# Altium project Membrane_Board.PrjPcb (part 2 of 2)

## Sheet Header_Sheet_4.SchDoc
size A4; SheetNumber: 10; SheetTotal: 12
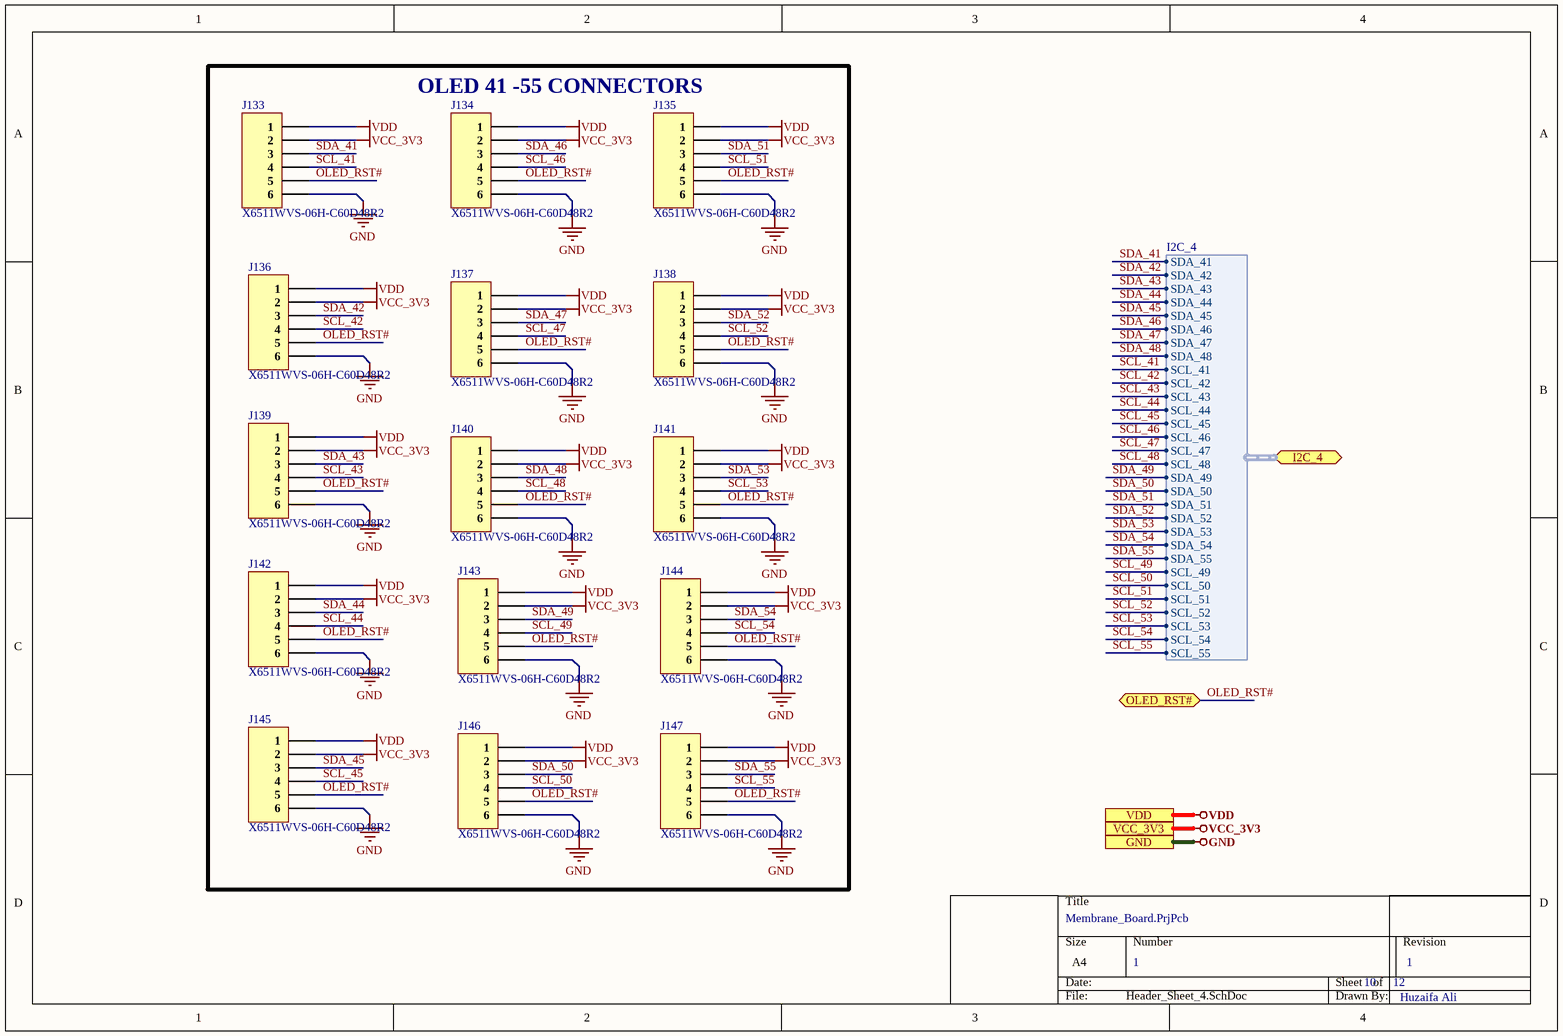
[diagram p9: Header_Sheet_4.SchDoc]

### Parts
J133  X6511WVS-06H-C60D48R2  [X6511WVS-06H-C60D48R2]
J134  X6511WVS-06H-C60D48R2  [X6511WVS-06H-C60D48R2]
J135  X6511WVS-06H-C60D48R2  [X6511WVS-06H-C60D48R2]
J136  X6511WVS-06H-C60D48R2  [X6511WVS-06H-C60D48R2]
J137  X6511WVS-06H-C60D48R2  [X6511WVS-06H-C60D48R2]
J138  X6511WVS-06H-C60D48R2  [X6511WVS-06H-C60D48R2]
J139  X6511WVS-06H-C60D48R2  [X6511WVS-06H-C60D48R2]
J140  X6511WVS-06H-C60D48R2  [X6511WVS-06H-C60D48R2]
J141  X6511WVS-06H-C60D48R2  [X6511WVS-06H-C60D48R2]
J142  X6511WVS-06H-C60D48R2  [X6511WVS-06H-C60D48R2]
J143  X6511WVS-06H-C60D48R2  [X6511WVS-06H-C60D48R2]
J144  X6511WVS-06H-C60D48R2  [X6511WVS-06H-C60D48R2]
J145  X6511WVS-06H-C60D48R2  [X6511WVS-06H-C60D48R2]
J146  X6511WVS-06H-C60D48R2  [X6511WVS-06H-C60D48R2]
J147  X6511WVS-06H-C60D48R2  [X6511WVS-06H-C60D48R2]

### Blocks framed on the sheet
OLED 41 -55 CONNECTORS: J133-J147

### Ports
GND, I2C_4 (bidir, harness I2C_4), OLED_RST# (bidir), VCC_3V3, VDD

### Harnesses
I2C_4: SDA_41, SDA_42, SDA_43, SDA_44, SDA_45, SDA_46, SDA_47, SDA_48, SCL_41, SCL_42, SCL_43, SCL_44, SCL_45, SCL_46, SCL_47, SCL_48, SDA_49, SDA_50, SDA_51, SDA_52, SDA_53, SDA_54, SDA_55, SCL_49, SCL_50, SCL_51, SCL_52, SCL_53, SCL_54, SCL_55

### Nets
GND: J133.6 J134.6 J135.6 J136.6 J137.6 J138.6 J139.6 J140.6 J141.6 J142.6 J143.6 J144.6 J145.6 J146.6 J147.6 ; port GND
VCC_3V3: J133.2 J134.2 J135.2 J136.2 J137.2 J138.2 J139.2 J140.2 J141.2 J142.2 J143.2 J144.2 J145.2 J146.2 J147.2 ; port VCC_3V3
VDD: J133.1 J134.1 J135.1 J136.1 J137.1 J138.1 J139.1 J140.1 J141.1 J142.1 J143.1 J144.1 J145.1 J146.1 J147.1 ; port VDD
OLED_RST#: J133.5 J134.5 J135.5 J136.5 J137.5 J138.5 J139.5 J140.5 J141.5 J142.5 J143.5 J144.5 J145.5 J146.5 J147.5 ; port OLED_RST#
SCL_41: J133.4 ; port I2C_4.SCL_41  [project net I2C_4.SCL_41]
SCL_42: J136.4 ; port I2C_4.SCL_42  [project net I2C_4.SCL_42]
SCL_43: J139.4 ; port I2C_4.SCL_43  [project net I2C_4.SCL_43]
SCL_44: J142.4 ; port I2C_4.SCL_44  [project net I2C_4.SCL_44]
SCL_45: J145.4 ; port I2C_4.SCL_45  [project net I2C_4.SCL_45]
SCL_46: J134.4 ; port I2C_4.SCL_46  [project net I2C_4.SCL_46]
SCL_47: J137.4 ; port I2C_4.SCL_47  [project net I2C_4.SCL_47]
SCL_48: J140.4 ; port I2C_4.SCL_48  [project net I2C_4.SCL_48]
SCL_49: J143.4 ; port I2C_4.SCL_49  [project net I2C_4.SCL_49]
SCL_50: J146.4 ; port I2C_4.SCL_50  [project net I2C_4.SCL_50]
SCL_51: J135.4 ; port I2C_4.SCL_51  [project net I2C_4.SCL_51]
SCL_52: J138.4 ; port I2C_4.SCL_52  [project net I2C_4.SCL_52]
SCL_53: J141.4 ; port I2C_4.SCL_53  [project net I2C_4.SCL_53]
SCL_54: J144.4 ; port I2C_4.SCL_54  [project net I2C_4.SCL_54]
SCL_55: J147.4 ; port I2C_4.SCL_55  [project net I2C_4.SCL_55]
SDA_41: J133.3 ; port I2C_4.SDA_41  [project net I2C_4.SDA_41]
SDA_42: J136.3 ; port I2C_4.SDA_42  [project net I2C_4.SDA_42]
SDA_43: J139.3 ; port I2C_4.SDA_43  [project net I2C_4.SDA_43]
SDA_44: J142.3 ; port I2C_4.SDA_44  [project net I2C_4.SDA_44]
SDA_45: J145.3 ; port I2C_4.SDA_45  [project net I2C_4.SDA_45]
SDA_46: J134.3 ; port I2C_4.SDA_46  [project net I2C_4.SDA_46]
SDA_47: J137.3 ; port I2C_4.SDA_47  [project net I2C_4.SDA_47]
SDA_48: J140.3 ; port I2C_4.SDA_48  [project net I2C_4.SDA_48]
SDA_49: J143.3 ; port I2C_4.SDA_49  [project net I2C_4.SDA_49]
SDA_50: J146.3 ; port I2C_4.SDA_50  [project net I2C_4.SDA_50]
SDA_51: J135.3 ; port I2C_4.SDA_51  [project net I2C_4.SDA_51]
SDA_52: J138.3 ; port I2C_4.SDA_52  [project net I2C_4.SDA_52]
SDA_53: J141.3 ; port I2C_4.SDA_53  [project net I2C_4.SDA_53]
SDA_54: J144.3 ; port I2C_4.SDA_54  [project net I2C_4.SDA_54]
SDA_55: J147.3 ; port I2C_4.SDA_55  [project net I2C_4.SDA_55]

### Notes on the sheet
- 1
- Huzaifa Ali

### Library data of the parts
J133-J147 = X6511WVS-06H-C60D48R2: 6 POS 2.54mm SMD Header; Manufacturer: XKB Connectivity; Voltage Rating (Max): 250V; Current Rating (Max): 3A; Circluar Pins/Square Pins: Square Pins; ComponentLink1Description: LCSC; ComponentLink1URL: https://lcsc.com/product-detail/span-style-background-color-ff0-Pin-span-Headers_XKB-Connectivity-X6511WVS-06H-C60D48R2_C2883763.html; Insulation Height: 2.5mm; Length of Mating Pin: 6mm

## Sheet Button_Sheet_1.SchDoc
size A; SheetNumber: 11; SheetTotal: 12
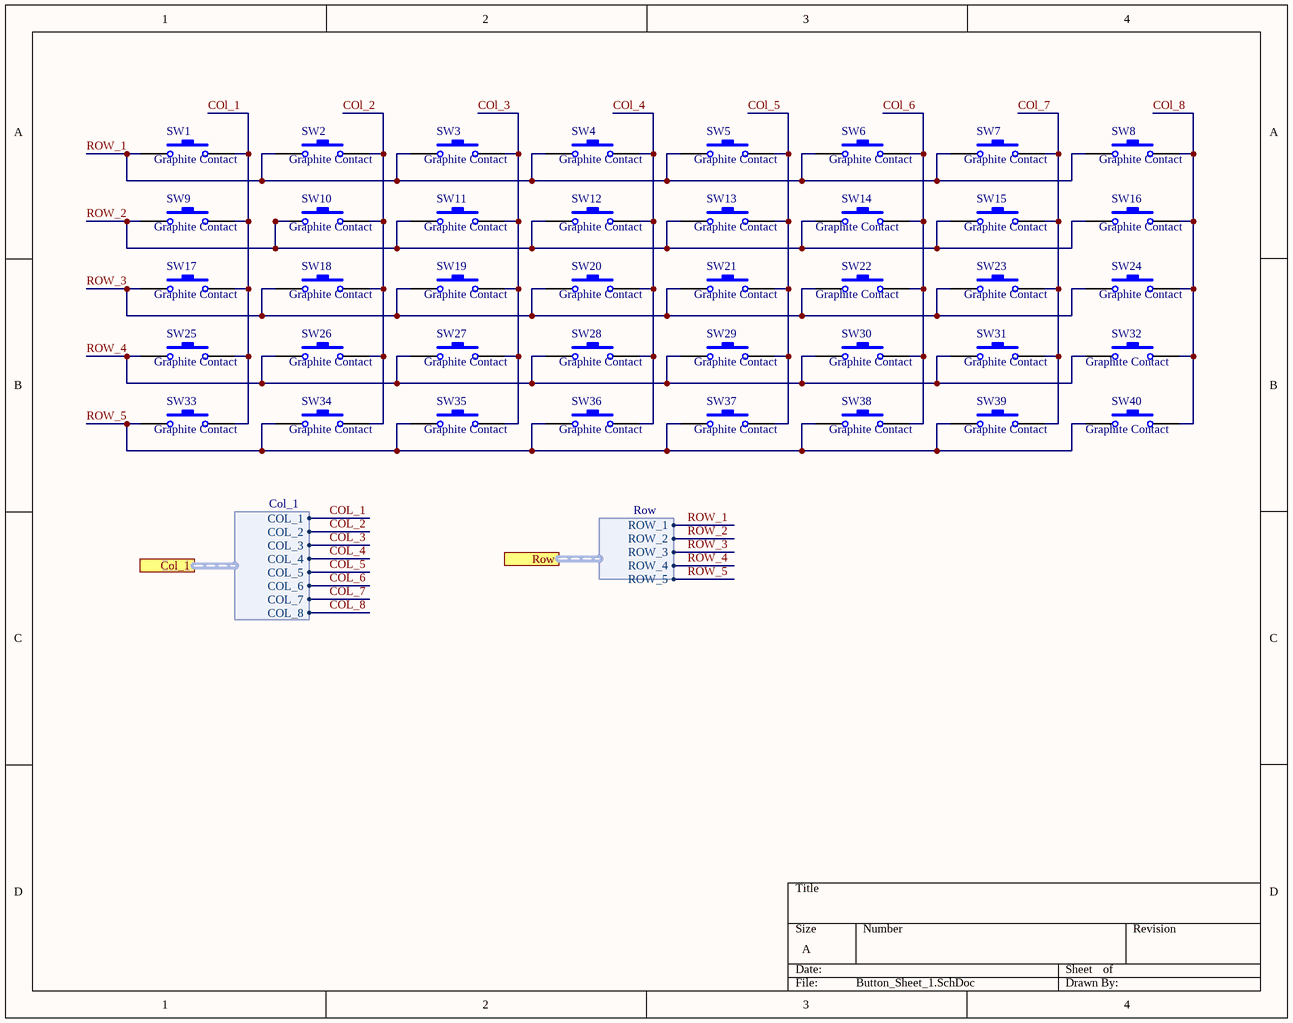
[diagram p10: Button_Sheet_1.SchDoc]

### Parts
SW1  Graphite Contact  [Graphite Contact]
SW2  Graphite Contact  [Graphite Contact]
SW3  Graphite Contact  [Graphite Contact]
SW4  Graphite Contact  [Graphite Contact]
SW5  Graphite Contact  [Graphite Contact]
SW6  Graphite Contact  [Graphite Contact]
SW7  Graphite Contact  [Graphite Contact]
SW8  Graphite Contact  [Graphite Contact]
SW9  Graphite Contact  [Graphite Contact]
SW10  Graphite Contact  [Graphite Contact]
SW11  Graphite Contact  [Graphite Contact]
SW12  Graphite Contact  [Graphite Contact]
SW13  Graphite Contact  [Graphite Contact]
SW14  Graphite Contact  [Graphite Contact]
SW15  Graphite Contact  [Graphite Contact]
SW16  Graphite Contact  [Graphite Contact]
SW17  Graphite Contact  [Graphite Contact]
SW18  Graphite Contact  [Graphite Contact]
SW19  Graphite Contact  [Graphite Contact]
SW20  Graphite Contact  [Graphite Contact]
SW21  Graphite Contact  [Graphite Contact]
SW22  Graphite Contact  [Graphite Contact]
SW23  Graphite Contact  [Graphite Contact]
SW24  Graphite Contact  [Graphite Contact]
SW25  Graphite Contact  [Graphite Contact]
SW26  Graphite Contact  [Graphite Contact]
SW27  Graphite Contact  [Graphite Contact]
SW28  Graphite Contact  [Graphite Contact]
SW29  Graphite Contact  [Graphite Contact]
SW30  Graphite Contact  [Graphite Contact]
SW31  Graphite Contact  [Graphite Contact]
SW32  Graphite Contact  [Graphite Contact]
SW33  Graphite Contact  [Graphite Contact]
SW34  Graphite Contact  [Graphite Contact]
SW35  Graphite Contact  [Graphite Contact]
SW36  Graphite Contact  [Graphite Contact]
SW37  Graphite Contact  [Graphite Contact]
SW38  Graphite Contact  [Graphite Contact]
SW39  Graphite Contact  [Graphite Contact]
SW40  Graphite Contact  [Graphite Contact]

### Ports
Col_1 (harness Col_1), Row (harness Row)

### Harnesses
Col_1: COL_8, COL_7, COL_6, COL_5, COL_4, COL_3, COL_2, COL_1
Row: ROW_5, ROW_4, ROW_3, ROW_2, ROW_1

### Nets
COL_1: SW1.2 SW9.2 SW17.2 SW25.2 SW33.2 ; port Col_1.COL_1
COl_2: SW2.2 SW10.2 SW18.2 SW26.2 SW34.2 ; port Col_1.COL_2  [project net Col_1.COL_2]
COl_3: SW3.2 SW11.2 SW19.2 SW27.2 SW35.2 ; port Col_1.COL_3  [project net Col_1.COL_3]
COl_4: SW4.2 SW12.2 SW20.2 SW28.2 SW36.2 ; port Col_1.COL_4  [project net Col_1.COL_4]
COl_5: SW5.2 SW13.2 SW21.2 SW29.2 SW37.2 ; port Col_1.COL_5  [project net Col_1.COL_5]
COl_6: SW6.2 SW14.2 SW22.2 SW30.2 SW38.2 ; port Col_1.COL_6  [project net Col_1.COL_6]
COl_7: SW7.2 SW15.2 SW23.2 SW31.2 SW39.2 ; port Col_1.COL_7  [project net Col_1.COL_7]
COl_8: SW8.2 SW16.2 SW24.2 SW32.2 SW40.2 ; port Col_1.COL_8  [project net Col_1.COL_8]
ROW_1: SW1.1 SW2.1 SW3.1 SW4.1 SW5.1 SW6.1 SW7.1 SW8.1 ; port Row.ROW_1  [project net Row.ROW_1]
ROW_2: SW9.1 SW10.1 SW11.1 SW12.1 SW13.1 SW14.1 SW15.1 SW16.1 ; port Row.ROW_2  [project net Row.ROW_2]
ROW_3: SW17.1 SW18.1 SW19.1 SW20.1 SW21.1 SW22.1 SW23.1 SW24.1 ; port Row.ROW_3  [project net Row.ROW_3]
ROW_4: SW25.1 SW26.1 SW27.1 SW28.1 SW29.1 SW30.1 SW31.1 SW32.1 ; port Row.ROW_4  [project net Row.ROW_4]
ROW_5: SW33.1 SW34.1 SW35.1 SW36.1 SW37.1 SW38.1 SW39.1 SW40.1 ; port Row.ROW_5  [project net Row.ROW_5]

### Library data of the parts
SW1-SW40 = Graphite Contact: Push Button for Graphite Contact

## Sheet Button_Sheet_2.SchDoc
size A; SheetNumber: 12; SheetTotal: 12
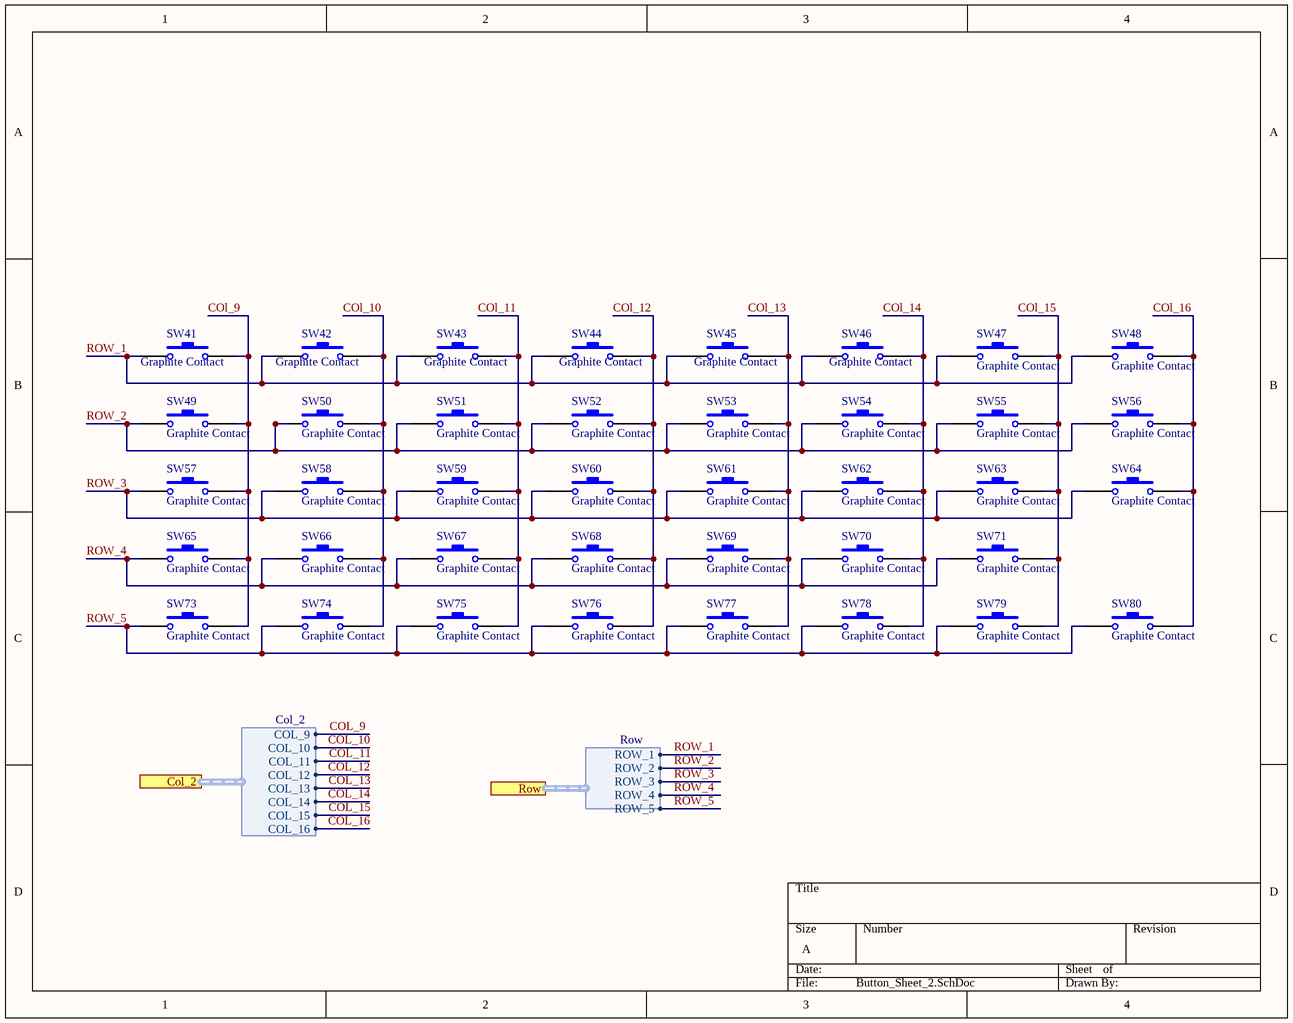
[diagram p11: Button_Sheet_2.SchDoc]

### Parts
SW41  Graphite Contact  [Graphite Contact]
SW42  Graphite Contact  [Graphite Contact]
SW43  Graphite Contact  [Graphite Contact]
SW44  Graphite Contact  [Graphite Contact]
SW45  Graphite Contact  [Graphite Contact]
SW46  Graphite Contact  [Graphite Contact]
SW47  Graphite Contact  [Graphite Contact]
SW48  Graphite Contact  [Graphite Contact]
SW49  Graphite Contact  [Graphite Contact]
SW50  Graphite Contact  [Graphite Contact]
SW51  Graphite Contact  [Graphite Contact]
SW52  Graphite Contact  [Graphite Contact]
SW53  Graphite Contact  [Graphite Contact]
SW54  Graphite Contact  [Graphite Contact]
SW55  Graphite Contact  [Graphite Contact]
SW56  Graphite Contact  [Graphite Contact]
SW57  Graphite Contact  [Graphite Contact]
SW58  Graphite Contact  [Graphite Contact]
SW59  Graphite Contact  [Graphite Contact]
SW60  Graphite Contact  [Graphite Contact]
SW61  Graphite Contact  [Graphite Contact]
SW62  Graphite Contact  [Graphite Contact]
SW63  Graphite Contact  [Graphite Contact]
SW64  Graphite Contact  [Graphite Contact]
SW65  Graphite Contact  [Graphite Contact]
SW66  Graphite Contact  [Graphite Contact]
SW67  Graphite Contact  [Graphite Contact]
SW68  Graphite Contact  [Graphite Contact]
SW69  Graphite Contact  [Graphite Contact]
SW70  Graphite Contact  [Graphite Contact]
SW71  Graphite Contact  [Graphite Contact]
SW73  Graphite Contact  [Graphite Contact]
SW74  Graphite Contact  [Graphite Contact]
SW75  Graphite Contact  [Graphite Contact]
SW76  Graphite Contact  [Graphite Contact]
SW77  Graphite Contact  [Graphite Contact]
SW78  Graphite Contact  [Graphite Contact]
SW79  Graphite Contact  [Graphite Contact]
SW80  Graphite Contact  [Graphite Contact]

### Ports
Col_2 (harness Col_2), Row (harness Row)

### Harnesses
Col_2: COL_16, COL_15, COL_14, COL_13, COL_12, COL_11, COL_10, COL_9
Row: ROW_5, ROW_4, ROW_3, ROW_2, ROW_1

### Nets
COl_9: SW41.2 SW49.2 SW57.2 SW65.2 SW73.2 ; port Col_2.COL_9  [project net Col_2.COL_9]
COL_10: SW42.2 SW50.2 SW58.2 SW66.2 SW74.2 ; port Col_2.COL_10
COL_11: SW43.2 SW51.2 SW59.2 SW67.2 SW75.2 ; port Col_2.COL_11
COL_12: SW44.2 SW52.2 SW60.2 SW68.2 SW76.2 ; port Col_2.COL_12
COL_13: SW45.2 SW53.2 SW61.2 SW69.2 SW77.2 ; port Col_2.COL_13
COL_14: SW46.2 SW54.2 SW62.2 SW70.2 SW78.2 ; port Col_2.COL_14
COL_15: SW47.2 SW55.2 SW63.2 SW71.2 SW79.2 ; port Col_2.COL_15
COL_16: SW48.2 SW56.2 SW64.2 SW80.2 ; port Col_2.COL_16
ROW_1: SW41.1 SW42.1 SW43.1 SW44.1 SW45.1 SW46.1 SW47.1 SW48.1 ; port Row.ROW_1  [project net Row.ROW_1]
ROW_2: SW49.1 SW50.1 SW51.1 SW52.1 SW53.1 SW54.1 SW55.1 SW56.1 ; port Row.ROW_2  [project net Row.ROW_2]
ROW_3: SW57.1 SW58.1 SW59.1 SW60.1 SW61.1 SW62.1 SW63.1 SW64.1 ; port Row.ROW_3  [project net Row.ROW_3]
ROW_4: SW65.1 SW66.1 SW67.1 SW68.1 SW69.1 SW70.1 SW71.1 ; port Row.ROW_4  [project net Row.ROW_4]
ROW_5: SW73.1 SW74.1 SW75.1 SW76.1 SW77.1 SW78.1 SW79.1 SW80.1 ; port Row.ROW_5  [project net Row.ROW_5]

### Library data of the parts
SW41-SW71 SW73-SW80 = Graphite Contact: Push Button for Graphite Contact

## Nets that join several sheets
GND: Connector_Sheet_1 (17 pins), Connector_Sheet_2 (25 pins), Connector_Sheet_3 (17 pins), Connector_Sheet_4 (7 pins), Controller_Sheet_5 (J75.26 J75.MP1 J75.MP2), Header_Sheet_1 (25 pins), Header_Sheet_2 (22 pins), Header_Sheet_3 (20 pins), Header_Sheet_4 (15 pins)
VCC_3V3: Connector_Sheet_1 (15 pins), Connector_Sheet_2 (25 pins), Connector_Sheet_3 (15 pins), Connector_Sheet_4 (7 pins), Controller_Sheet_5 (J75.25), Header_Sheet_1 (25 pins), Header_Sheet_2 (22 pins), Header_Sheet_3 (20 pins), Header_Sheet_4 (15 pins)
VDD: Connector_Sheet_1 (15 pins), Connector_Sheet_2 (25 pins), Connector_Sheet_3 (15 pins), Connector_Sheet_4 (7 pins), Controller_Sheet_5 (J75.24), Header_Sheet_1 (25 pins), Header_Sheet_2 (22 pins), Header_Sheet_3 (20 pins), Header_Sheet_4 (15 pins)
COL_1: Controller_Sheet_5 (J75.1 P1.1), Button_Sheet_1 (5 pins)
Col_1.COL_2: Controller_Sheet_5 (J75.2 P2.1), Button_Sheet_1 (5 pins)
Col_1.COL_3: Controller_Sheet_5 (J75.3 P3.1), Button_Sheet_1 (5 pins)
Col_1.COL_4: Controller_Sheet_5 (J75.4 P4.1), Button_Sheet_1 (5 pins)
Col_1.COL_5: Controller_Sheet_5 (J75.5 P5.1), Button_Sheet_1 (5 pins)
Col_1.COL_6: Controller_Sheet_5 (J75.6 P6.1), Button_Sheet_1 (5 pins)
Col_1.COL_7: Controller_Sheet_5 (J75.7 P7.1), Button_Sheet_1 (5 pins)
Col_1.COL_8: Controller_Sheet_5 (J75.8 P8.1), Button_Sheet_1 (5 pins)
Col_2.COL_9: Controller_Sheet_5 (J75.9 P9.1), Button_Sheet_2 (5 pins)
COL_10: Controller_Sheet_5 (J75.10 P10.1), Button_Sheet_2 (5 pins)
COL_11: Controller_Sheet_5 (J75.11 P11.1), Button_Sheet_2 (5 pins)
COL_12: Controller_Sheet_5 (J75.12 P12.1), Button_Sheet_2 (5 pins)
COL_13: Controller_Sheet_5 (J75.13 P13.1), Button_Sheet_2 (5 pins)
COL_14: Controller_Sheet_5 (J75.14 P14.1), Button_Sheet_2 (5 pins)
COL_15: Controller_Sheet_5 (J75.15 P15.1), Button_Sheet_2 (5 pins)
COL_16: Controller_Sheet_5 (J75.16 P16.1), Button_Sheet_2 (SW48.2 SW56.2 SW64.2 SW80.2)
I2C1.SCL_1: Connector_Sheet_1 (J4.9), Connector_Sheet_2 (J17.4), Header_Sheet_1 (J45.4)
I2C1.SCL_2: Connector_Sheet_1 (J4.10), Connector_Sheet_2 (J22.4), Header_Sheet_1 (J57.4)
I2C1.SCL_3: Connector_Sheet_1 (J4.11), Connector_Sheet_2 (J27.4), Header_Sheet_1 (J76.4)
I2C1.SCL_4: Connector_Sheet_1 (J4.12), Connector_Sheet_2 (J32.4), Header_Sheet_1 (J81.4)
I2C1.SCL_5: Connector_Sheet_1 (J4.13), Connector_Sheet_2 (J37.4), Header_Sheet_1 (J86.4)
I2C1.SCL_6: Connector_Sheet_1 (J4.14), Connector_Sheet_2 (J18.4), Header_Sheet_1 (J46.4)
I2C1.SCL_7: Connector_Sheet_1 (J4.15), Connector_Sheet_2 (J23.4), Header_Sheet_1 (J61.4)
I2C1.SCL_8: Connector_Sheet_1 (J4.16), Connector_Sheet_2 (J28.4), Header_Sheet_1 (J77.4)
I2C1.SCL_9: Connector_Sheet_1 (J4.25), Connector_Sheet_2 (J33.4), Header_Sheet_1 (J82.4)
I2C1.SCL_10: Connector_Sheet_1 (J4.26), Connector_Sheet_2 (J38.4), Header_Sheet_1 (J87.4)
I2C1.SCL_11: Connector_Sheet_1 (J4.27), Connector_Sheet_2 (J19.4), Header_Sheet_1 (J51.4)
I2C1.SCL_12: Connector_Sheet_1 (J4.28), Connector_Sheet_2 (J24.4), Header_Sheet_1 (J62.4)
I2C1.SCL_13: Connector_Sheet_1 (J4.29), Connector_Sheet_2 (J29.4), Header_Sheet_1 (J78.4)
I2C1.SCL_14: Connector_Sheet_1 (J4.30), Connector_Sheet_2 (J34.4), Header_Sheet_1 (J83.4)
I2C1.SCL_15: Connector_Sheet_1 (J4.31), Connector_Sheet_2 (J39.4), Header_Sheet_1 (J88.4)
I2C1.SCL_16: Connector_Sheet_1 (J4.32), Connector_Sheet_2 (J20.4), Header_Sheet_1 (J52.4)
I2C1.SCL_17: Connector_Sheet_1 (J4.41), Connector_Sheet_2 (J25.4), Header_Sheet_1 (J66.4)
I2C1.SCL_18: Connector_Sheet_1 (J4.42), Connector_Sheet_2 (J30.4), Header_Sheet_1 (J79.4)
I2C1.SCL_19: Connector_Sheet_1 (J4.43), Connector_Sheet_2 (J35.4), Header_Sheet_1 (J84.4)
I2C1.SCL_20: Connector_Sheet_1 (J4.44), Connector_Sheet_2 (J40.4), Header_Sheet_1 (J89.4)
I2C1.SCL_21: Connector_Sheet_1 (J4.45), Connector_Sheet_2 (J21.4), Header_Sheet_1 (J56.4)
I2C1.SCL_22: Connector_Sheet_1 (J4.46), Connector_Sheet_2 (J26.4), Header_Sheet_1 (J67.4)
I2C1.SCL_23: Connector_Sheet_1 (J4.47), Connector_Sheet_2 (J31.4), Header_Sheet_1 (J80.4)
I2C1.SCL_24: Connector_Sheet_1 (J4.48), Connector_Sheet_2 (J36.4), Header_Sheet_1 (J85.4)
I2C1.SCL_25: Connector_Sheet_1 (J4.57), Connector_Sheet_2 (J41.4), Header_Sheet_1 (J90.4)
I2C1.SDA_1: Connector_Sheet_1 (J4.1), Connector_Sheet_2 (J17.3), Header_Sheet_1 (J45.3)
I2C1.SDA_2: Connector_Sheet_1 (J4.2), Connector_Sheet_2 (J22.3), Header_Sheet_1 (J57.3)
I2C1.SDA_3: Connector_Sheet_1 (J4.3), Connector_Sheet_2 (J27.3), Header_Sheet_1 (J76.3)
I2C1.SDA_4: Connector_Sheet_1 (J4.4), Connector_Sheet_2 (J32.3), Header_Sheet_1 (J81.3)
I2C1.SDA_5: Connector_Sheet_1 (J4.5), Connector_Sheet_2 (J37.3), Header_Sheet_1 (J86.3)
I2C1.SDA_6: Connector_Sheet_1 (J4.6), Connector_Sheet_2 (J18.3), Header_Sheet_1 (J46.3)
I2C1.SDA_7: Connector_Sheet_1 (J4.7), Connector_Sheet_2 (J23.3), Header_Sheet_1 (J61.3)
I2C1.SDA_8: Connector_Sheet_1 (J4.8), Connector_Sheet_2 (J28.3), Header_Sheet_1 (J77.3)
I2C1.SDA_9: Connector_Sheet_1 (J4.17), Connector_Sheet_2 (J33.3), Header_Sheet_1 (J82.3)
I2C1.SDA_10: Connector_Sheet_1 (J4.18), Connector_Sheet_2 (J38.3), Header_Sheet_1 (J87.3)
I2C1.SDA_11: Connector_Sheet_1 (J4.19), Connector_Sheet_2 (J19.3), Header_Sheet_1 (J51.3)
I2C1.SDA_12: Connector_Sheet_1 (J4.20), Connector_Sheet_2 (J24.3), Header_Sheet_1 (J62.3)
I2C1.SDA_13: Connector_Sheet_1 (J4.21), Connector_Sheet_2 (J29.3), Header_Sheet_1 (J78.3)
I2C1.SDA_14: Connector_Sheet_1 (J4.22), Connector_Sheet_2 (J34.3), Header_Sheet_1 (J83.3)
I2C1.SDA_15: Connector_Sheet_1 (J4.23), Connector_Sheet_2 (J39.3), Header_Sheet_1 (J88.3)
I2C1.SDA_16: Connector_Sheet_1 (J4.24), Connector_Sheet_2 (J20.3), Header_Sheet_1 (J52.3)
I2C1.SDA_17: Connector_Sheet_1 (J4.33), Connector_Sheet_2 (J25.3), Header_Sheet_1 (J66.3)
I2C1.SDA_18: Connector_Sheet_1 (J4.34), Connector_Sheet_2 (J30.3), Header_Sheet_1 (J79.3)
I2C1.SDA_19: Connector_Sheet_1 (J4.35), Connector_Sheet_2 (J35.3), Header_Sheet_1 (J84.3)
I2C1.SDA_20: Connector_Sheet_1 (J4.36), Connector_Sheet_2 (J40.3), Header_Sheet_1 (J89.3)
I2C1.SDA_21: Connector_Sheet_1 (J4.37), Connector_Sheet_2 (J21.3), Header_Sheet_1 (J56.3)
I2C1.SDA_22: Connector_Sheet_1 (J4.38), Connector_Sheet_2 (J26.3), Header_Sheet_1 (J67.3)
I2C1.SDA_23: Connector_Sheet_1 (J4.39), Connector_Sheet_2 (J31.3), Header_Sheet_1 (J80.3)
I2C1.SDA_24: Connector_Sheet_1 (J4.40), Connector_Sheet_2 (J36.3), Header_Sheet_1 (J85.3)
I2C1.SDA_25: Connector_Sheet_1 (J4.49), Connector_Sheet_2 (J41.3), Header_Sheet_1 (J90.3)
I2C5.SCL_26: Connector_Sheet_1 (J1.4 J4.58), Header_Sheet_2 (J91.4)
I2C5.SCL_27: Connector_Sheet_1 (J4.59 J5.4), Header_Sheet_2 (J96.4)
I2C5.SCL_28: Connector_Sheet_1 (J4.60 J8.4), Header_Sheet_2 (J101.4)
I2C5.SCL_29: Connector_Sheet_1 (J4.61 J11.4), Header_Sheet_2 (J106.4)
I2C5.SCL_30: Connector_Sheet_1 (J4.62 J14.4), Header_Sheet_2 (J110.4)
I2C5.SCL_31: Connector_Sheet_1 (J2.4 J4.63), Header_Sheet_2 (J92.4)
I2C5.SCL_32: Connector_Sheet_1 (J4.64 J6.4), Header_Sheet_2 (J97.4)
I2C5.SCL_33: Connector_Sheet_1 (J4.73 J9.4), Header_Sheet_2 (J102.4)
I2C5.SCL_34: Connector_Sheet_1 (J4.74 J12.4), Header_Sheet_2 (J107.4)
I2C5.SCL_35: Connector_Sheet_1 (J4.75 J15.4), Header_Sheet_2 (J111.4)
I2C5.SCL_36: Connector_Sheet_1 (J3.4 J4.76), Header_Sheet_2 (J93.4)
I2C5.SCL_37: Connector_Sheet_1 (J4.77 J7.4), Header_Sheet_2 (J98.4)
I2C5.SCL_38: Connector_Sheet_1 (J4.78 J10.4), Header_Sheet_2 (J103.4)
I2C5.SCL_39: Connector_Sheet_1 (J4.79 J13.4), Header_Sheet_2 (J108.4)
I2C5.SCL_40: Connector_Sheet_1 (J4.80 J16.4), Header_Sheet_2 (J112.4)
I2C5.SDA_26: Connector_Sheet_1 (J1.3 J4.50), Header_Sheet_2 (J91.3)
I2C5.SDA_27: Connector_Sheet_1 (J4.51 J5.3), Header_Sheet_2 (J96.3)
I2C5.SDA_28: Connector_Sheet_1 (J4.52 J8.3), Header_Sheet_2 (J101.3)
I2C5.SDA_29: Connector_Sheet_1 (J4.53 J11.3), Header_Sheet_2 (J106.3)
I2C5.SDA_30: Connector_Sheet_1 (J4.54 J14.3), Header_Sheet_2 (J110.3)
I2C5.SDA_31: Connector_Sheet_1 (J2.3 J4.55), Header_Sheet_2 (J92.3)
I2C5.SDA_32: Connector_Sheet_1 (J4.56 J6.3), Header_Sheet_2 (J97.3)
I2C5.SDA_33: Connector_Sheet_1 (J4.65 J9.3), Header_Sheet_2 (J102.3)
I2C5.SDA_34: Connector_Sheet_1 (J4.66 J12.3), Header_Sheet_2 (J107.3)
I2C5.SDA_35: Connector_Sheet_1 (J4.67 J15.3), Header_Sheet_2 (J111.3)
I2C5.SDA_36: Connector_Sheet_1 (J3.3 J4.68), Header_Sheet_2 (J93.3)
I2C5.SDA_37: Connector_Sheet_1 (J4.69 J7.3), Header_Sheet_2 (J98.3)
I2C5.SDA_38: Connector_Sheet_1 (J4.70 J10.3), Header_Sheet_2 (J103.3)
I2C5.SDA_39: Connector_Sheet_1 (J4.71 J13.3), Header_Sheet_2 (J108.3)
I2C5.SDA_40: Connector_Sheet_1 (J4.72 J16.3), Header_Sheet_2 (J112.3)
I2C_2.SCL_66: Connector_Sheet_3 (J47.58), Connector_Sheet_4 (J68.4), Header_Sheet_2 (J94.4)
I2C_2.SCL_67: Connector_Sheet_3 (J47.59), Connector_Sheet_4 (J70.4), Header_Sheet_2 (J99.4)
I2C_2.SCL_68: Connector_Sheet_3 (J47.60), Connector_Sheet_4 (J72.4), Header_Sheet_2 (J104.4)
I2C_2.SCL_69: Connector_Sheet_3 (J47.61), Connector_Sheet_4 (J74.4), Header_Sheet_2 (J109.4)
I2C_2.SCL_70: Connector_Sheet_3 (J47.62), Connector_Sheet_4 (J69.4), Header_Sheet_2 (J95.4)
I2C_2.SCL_71: Connector_Sheet_3 (J47.63), Connector_Sheet_4 (J71.4), Header_Sheet_2 (J100.4)
I2C_2.SCL_72: Connector_Sheet_3 (J47.64), Connector_Sheet_4 (J73.4), Header_Sheet_2 (J105.4)
I2C_2.SDA_66: Connector_Sheet_3 (J47.50), Connector_Sheet_4 (J68.3), Header_Sheet_2 (J94.3)
I2C_2.SDA_67: Connector_Sheet_3 (J47.51), Connector_Sheet_4 (J70.3), Header_Sheet_2 (J99.3)
I2C_2.SDA_68: Connector_Sheet_3 (J47.52), Connector_Sheet_4 (J72.3), Header_Sheet_2 (J104.3)
I2C_2.SDA_69: Connector_Sheet_3 (J47.53), Connector_Sheet_4 (J74.3), Header_Sheet_2 (J109.3)
I2C_2.SDA_70: Connector_Sheet_3 (J47.54), Connector_Sheet_4 (J69.3), Header_Sheet_2 (J95.3)
I2C_2.SDA_71: Connector_Sheet_3 (J47.55), Connector_Sheet_4 (J71.3), Header_Sheet_2 (J100.3)
I2C_2.SDA_72: Connector_Sheet_3 (J47.56), Connector_Sheet_4 (J73.3), Header_Sheet_2 (J105.3)
I2C_3.SCL_56: Connector_Sheet_3 (J47.32), Header_Sheet_3 (J113.4 J115.4)
I2C_3.SCL_57: Connector_Sheet_3 (J47.41), Header_Sheet_3 (J117.4 J119.4)
I2C_3.SCL_58: Connector_Sheet_3 (J47.42), Header_Sheet_3 (J121.4 J123.4)
I2C_3.SCL_59: Connector_Sheet_3 (J47.43), Header_Sheet_3 (J125.4 J128.4)
I2C_3.SCL_60: Connector_Sheet_3 (J47.44), Header_Sheet_3 (J129.4 J131.4)
I2C_3.SCL_61: Connector_Sheet_3 (J47.45), Header_Sheet_3 (J114.4 J116.4)
I2C_3.SCL_62: Connector_Sheet_3 (J47.46), Header_Sheet_3 (J118.4 J120.4)
I2C_3.SCL_63: Connector_Sheet_3 (J47.47), Header_Sheet_3 (J122.4 J124.4)
I2C_3.SCL_64: Connector_Sheet_3 (J47.48), Header_Sheet_3 (J126.4 J127.4)
I2C_3.SCL_65: Connector_Sheet_3 (J47.57), Header_Sheet_3 (J130.4 J132.4)
I2C_3.SDA_56: Connector_Sheet_3 (J47.24), Header_Sheet_3 (J113.3 J115.3)
I2C_3.SDA_57: Connector_Sheet_3 (J47.33), Header_Sheet_3 (J117.3 J119.3)
I2C_3.SDA_58: Connector_Sheet_3 (J47.34), Header_Sheet_3 (J121.3 J123.3)
I2C_3.SDA_59: Connector_Sheet_3 (J47.35), Header_Sheet_3 (J125.3 J128.3)
I2C_3.SDA_60: Connector_Sheet_3 (J47.36), Header_Sheet_3 (J129.3 J131.3)
I2C_3.SDA_61: Connector_Sheet_3 (J47.37), Header_Sheet_3 (J114.3 J116.3)
I2C_3.SDA_62: Connector_Sheet_3 (J47.38), Header_Sheet_3 (J118.3 J120.3)
I2C_3.SDA_63: Connector_Sheet_3 (J47.39), Header_Sheet_3 (J122.3 J124.3)
I2C_3.SDA_64: Connector_Sheet_3 (J47.40), Header_Sheet_3 (J126.3 J127.3)
I2C_3.SDA_65: Connector_Sheet_3 (J47.49), Header_Sheet_3 (J130.3 J132.3)
I2C_4.SCL_41: Connector_Sheet_3 (J42.4 J47.9), Header_Sheet_4 (J133.4)
I2C_4.SCL_42: Connector_Sheet_3 (J47.10 J48.4), Header_Sheet_4 (J136.4)
I2C_4.SCL_43: Connector_Sheet_3 (J47.11 J53.4), Header_Sheet_4 (J139.4)
I2C_4.SCL_44: Connector_Sheet_3 (J47.12 J58.4), Header_Sheet_4 (J142.4)
I2C_4.SCL_45: Connector_Sheet_3 (J47.13 J63.4), Header_Sheet_4 (J145.4)
I2C_4.SCL_46: Connector_Sheet_3 (J43.4 J47.14), Header_Sheet_4 (J134.4)
I2C_4.SCL_47: Connector_Sheet_3 (J47.15 J49.4), Header_Sheet_4 (J137.4)
I2C_4.SCL_48: Connector_Sheet_3 (J47.16 J54.4), Header_Sheet_4 (J140.4)
I2C_4.SCL_49: Connector_Sheet_3 (J47.25 J59.4), Header_Sheet_4 (J143.4)
I2C_4.SCL_50: Connector_Sheet_3 (J47.26 J64.4), Header_Sheet_4 (J146.4)
I2C_4.SCL_51: Connector_Sheet_3 (J44.4 J47.27), Header_Sheet_4 (J135.4)
I2C_4.SCL_52: Connector_Sheet_3 (J47.28 J50.4), Header_Sheet_4 (J138.4)
I2C_4.SCL_53: Connector_Sheet_3 (J47.29 J55.4), Header_Sheet_4 (J141.4)
I2C_4.SCL_54: Connector_Sheet_3 (J47.30 J60.4), Header_Sheet_4 (J144.4)
I2C_4.SCL_55: Connector_Sheet_3 (J47.31 J65.4), Header_Sheet_4 (J147.4)
I2C_4.SDA_41: Connector_Sheet_3 (J42.3 J47.1), Header_Sheet_4 (J133.3)
I2C_4.SDA_42: Connector_Sheet_3 (J47.2 J48.3), Header_Sheet_4 (J136.3)
I2C_4.SDA_43: Connector_Sheet_3 (J47.3 J53.3), Header_Sheet_4 (J139.3)
I2C_4.SDA_44: Connector_Sheet_3 (J47.4 J58.3), Header_Sheet_4 (J142.3)
I2C_4.SDA_45: Connector_Sheet_3 (J47.5 J63.3), Header_Sheet_4 (J145.3)
I2C_4.SDA_46: Connector_Sheet_3 (J43.3 J47.6), Header_Sheet_4 (J134.3)
I2C_4.SDA_47: Connector_Sheet_3 (J47.7 J49.3), Header_Sheet_4 (J137.3)
I2C_4.SDA_48: Connector_Sheet_3 (J47.8 J54.3), Header_Sheet_4 (J140.3)
I2C_4.SDA_49: Connector_Sheet_3 (J47.17 J59.3), Header_Sheet_4 (J143.3)
I2C_4.SDA_50: Connector_Sheet_3 (J47.18 J64.3), Header_Sheet_4 (J146.3)
I2C_4.SDA_51: Connector_Sheet_3 (J44.3 J47.19), Header_Sheet_4 (J135.3)
I2C_4.SDA_52: Connector_Sheet_3 (J47.20 J50.3), Header_Sheet_4 (J138.3)
I2C_4.SDA_53: Connector_Sheet_3 (J47.21 J55.3), Header_Sheet_4 (J141.3)
I2C_4.SDA_54: Connector_Sheet_3 (J47.22 J60.3), Header_Sheet_4 (J144.3)
I2C_4.SDA_55: Connector_Sheet_3 (J47.23 J65.3), Header_Sheet_4 (J147.3)
OLED_RST#: Connector_Sheet_1 (15 pins), Connector_Sheet_2 (25 pins), Connector_Sheet_3 (16 pins), Connector_Sheet_4 (7 pins), Header_Sheet_1 (25 pins), Header_Sheet_2 (22 pins), Header_Sheet_3 (20 pins), Header_Sheet_4 (15 pins)
Row.ROW_1: Controller_Sheet_5 (J75.17 P17.1), Button_Sheet_1 (8 pins), Button_Sheet_2 (8 pins)
Row.ROW_2: Controller_Sheet_5 (J75.18 P18.1), Button_Sheet_1 (8 pins), Button_Sheet_2 (8 pins)
Row.ROW_3: Controller_Sheet_5 (J75.19 P19.1), Button_Sheet_1 (8 pins), Button_Sheet_2 (8 pins)
Row.ROW_4: Controller_Sheet_5 (J75.20 P20.1), Button_Sheet_1 (8 pins), Button_Sheet_2 (7 pins)
Row.ROW_5: Controller_Sheet_5 (J75.21 P21.1), Button_Sheet_1 (8 pins), Button_Sheet_2 (8 pins)